# EAGLE design 261803x-HW-V1 (EAGLE 7.7.0)
Assembly variants: Thetis-I, Setebos-I, Proteus-III
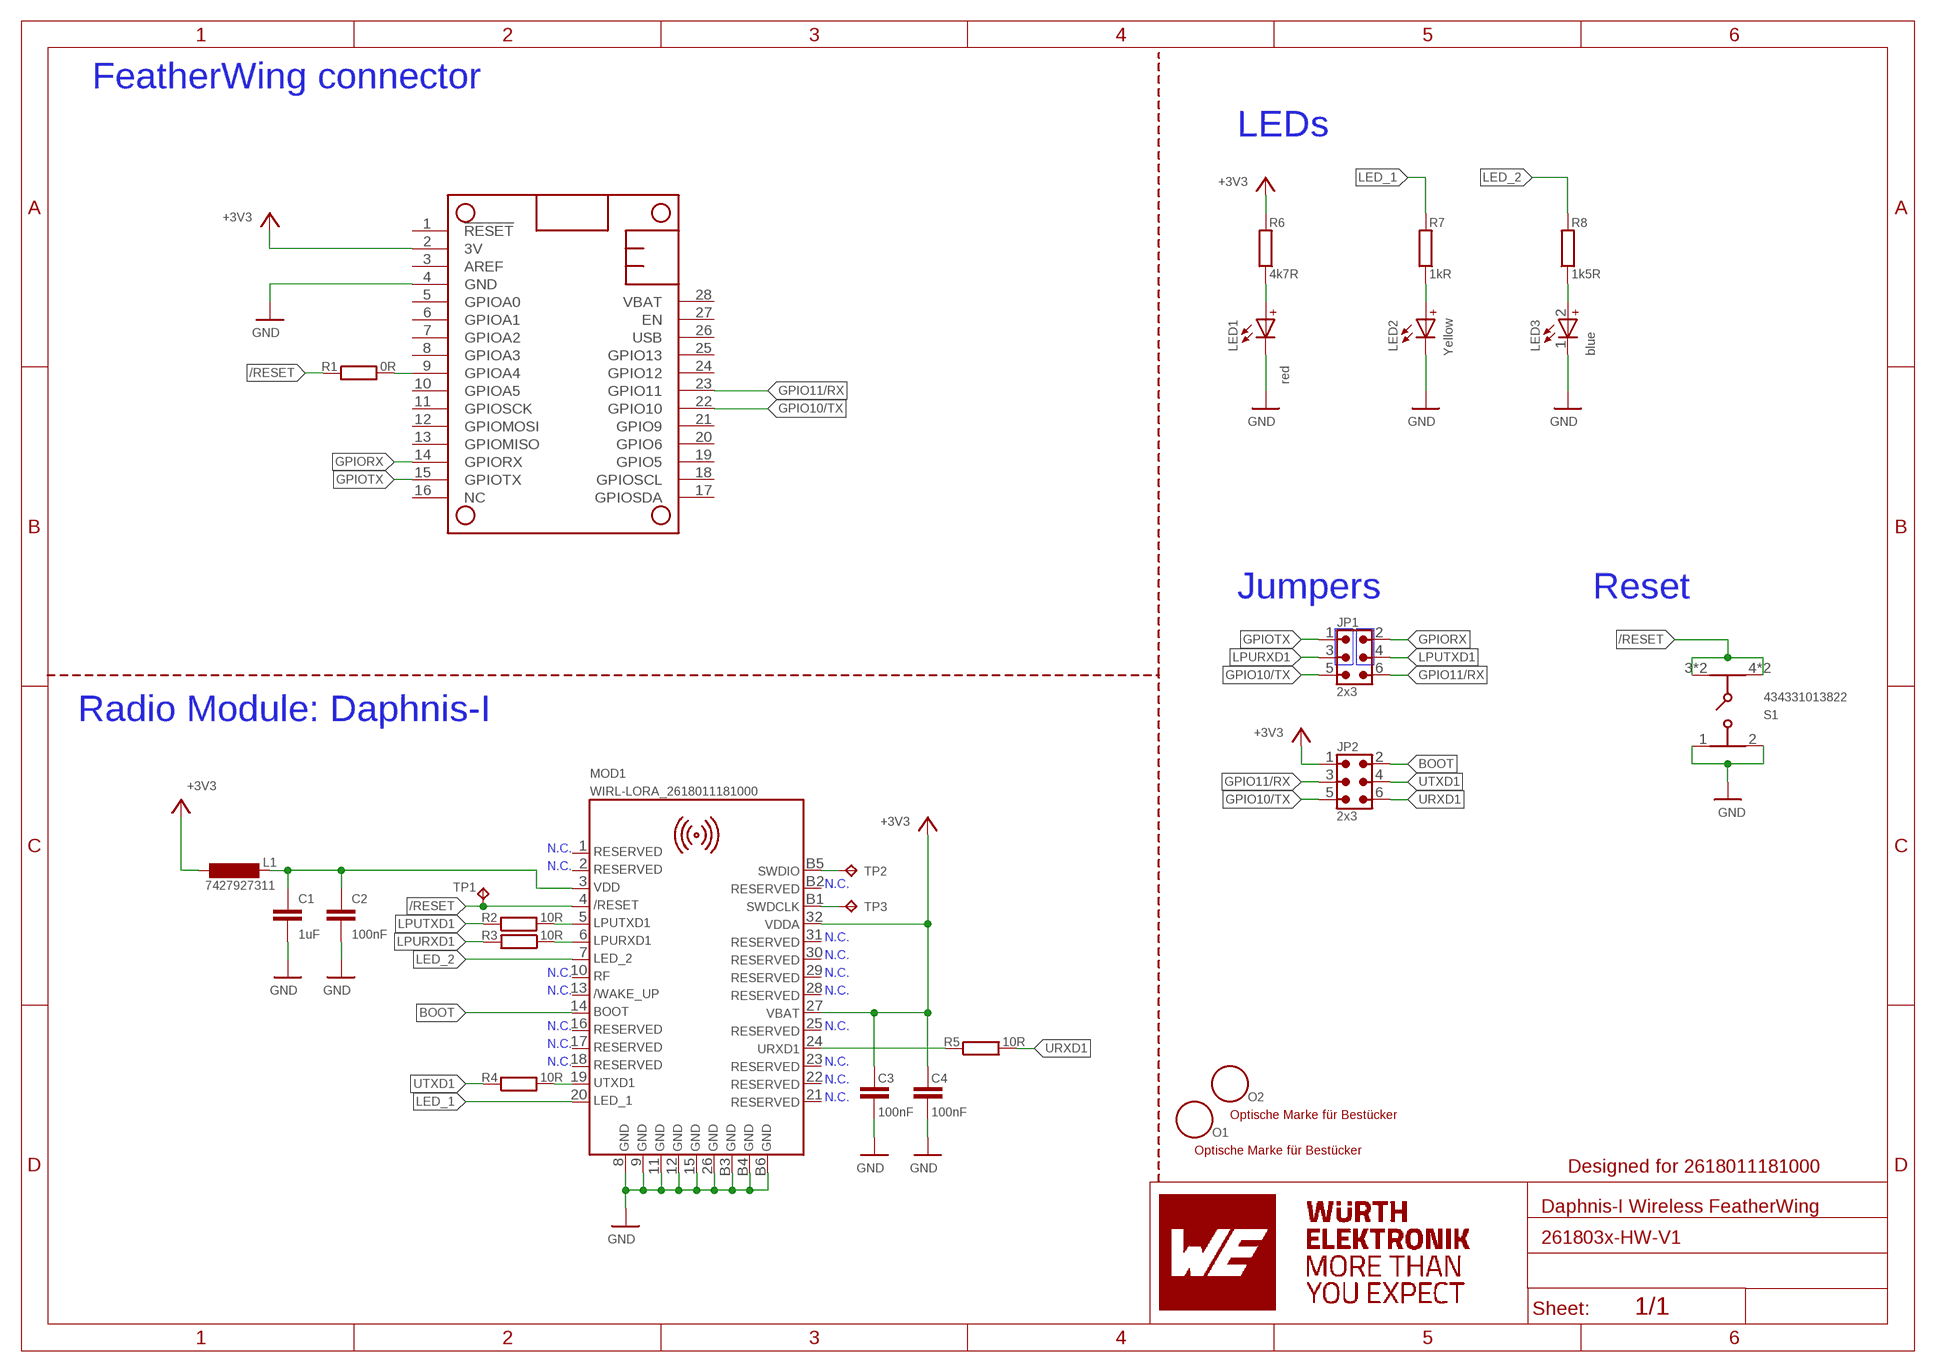
[diagram p0: schematic, sheet 1]

## Parts
C1  1uF  C1UF0402_IPC  [C0402_IPC]
C2  100nF  C100NF0402_IPC  [C0402_IPC]
C3  100nF  C100NF0402_IPC  [C0402_IPC]
C4  100nF  C100NF0402_IPC  [C0402_IPC]
JP1  2x3  6130XX21121_61300621121  [61300621121]
JP2  2x3  6130XX21121_61300621121  [61300621121]
L1  7427927311  LL0402_WE-MK  [L0402_WE-MK]
LED1  red  WL-SMSW_1204_155124VS73200  [WL-SMSW_1204_A]
LED2  Yellow  WL-SMSW_1204_155124YS73200  [WL-SMSW_1204_A]
LED3  blue  WL-SMSW_1204_155124BS73200A  [WL-SMSW_1204_A]
MOD1  WIRL-LORA_2618011181000  [WE-FP-8]
MS1  header: 1 x 12 & 1 x 16  FEATHERWING  [FEATHERWING]
O1  n.m.  OPT_MARKE  [OPTISCHE_MARKE]
O2  n.m.  OPT_MARKE  [OPTISCHE_MARKE]
R1  0R  R0R0402_IPC  [R0402_IPC]
R2  10R  R10R0402_IPC  [R0402_IPC]
R3  10R  R10R0402_IPC  [R0402_IPC]
R4  10R  R10R0402_IPC  [R0402_IPC]
R5  10R  R10R0402_IPC  [R0402_IPC]
R6  4k7R  R4K70402_IPC  [R0402_IPC]
R7  1kR  R1K0402_IPC  [R0402_IPC]
R8  1k5R  R1K5R0402_IPC  [R0402_IPC]
S1  434331013822  [434331013822]
TP1  TP15R  [TP15R]
TP2  TP15R  [TP15R]
TP3  TP15R  [TP15R]

## Nets
+3V3: C3.1 C4.1 JP2.1 L1.P$2 MOD1.27 MOD1.32 MS1.2(3V) R6.2
/RESET: MOD1.4 R1.1 S1.3 S1.4 S1.5 S1.6 TP1.P$1(TP)
BOOT: JP2.2 MOD1.14
GND: C1.2 C2.2 C3.2 C4.2 LED1.1(-) LED2.1(-) LED3.1(-) MOD1.8 MOD1.9 MOD1.11 MOD1.12 MOD1.15 MOD1.26 MOD1.B3 MOD1.B4 MOD1.B6 MS1.4(GND) S1.1 S1.2
GPIO10/TX: JP1.5 JP2.5 MS1.22(GPIO10)
GPIO11/RX: JP1.6 JP2.3 MS1.23(GPIO11)
GPIORX: JP1.2 MS1.14(GPIORX)
GPIOTX: JP1.1 MS1.15(GPIOTX)
LED_1: MOD1.20 R7.2
LED_2: MOD1.7 R8.2
LPURXD1: JP1.3 R3.2
LPUTXD1: JP1.4 R2.1
N$1: LED1.2(+) R6.1
N$2: LED2.2(+) R7.1
N$4: LED3.2(+) R8.1
N$6: C1.1 C2.1 L1.P$1 MOD1.3
N$7: MOD1.19 R4.2
N$8: MOD1.24 R5.1
N$9: MS1.9(GPIOA4) R1.2
N$10: MOD1.6 R3.1
N$11: MOD1.5 R2.2
SWDCLK: MOD1.B1 TP3.P$1(TP)
SWDIO: MOD1.B5 TP2.P$1(TP)
URXD1: JP2.6 R5.2
UTXD1: JP2.4 R4.1
Unconnected: MOD1.1 MOD1.2 MOD1.10 MOD1.13 MOD1.16 MOD1.17 MOD1.18 MOD1.21 MOD1.22 MOD1.23 MOD1.25 MOD1.28 MOD1.29 MOD1.30 MOD1.31 MOD1.B2 MS1.1(!RESET) MS1.3(AREF) MS1.5(GPIOA0) MS1.6(GPIOA1) MS1.7(GPIOA2) MS1.8(GPIOA3) MS1.10(GPIOA5) MS1.11(GPIOSCK) MS1.12(GPIOMOSI) MS1.13(GPIOMISO) MS1.16(NC) MS1.17(GPIOSDA) MS1.18(GPIOSCL) MS1.19(GPIO5) MS1.20(GPIO6) MS1.21(GPIO9) MS1.24(GPIO12) MS1.25(GPIO13) MS1.26(USB) MS1.27(EN) MS1.28(VBAT)

## Notes on the sheet
- FeatherWing connector
- LEDs
- Jumpers | Reset
- Radio Module: Daphnis-I
- N.C.
- N.C.
- N.C.
- N.C.
- N.C.
- N.C. | N.C.
- N.C. | N.C.
- N.C. | N.C.
- N.C.
- N.C. | N.C.
- N.C.
- N.C.
- Designed for 2618011181000
- Daphnis-I Wireless FeatherWing

## Library data of the parts
C1 = rcl-WE:C; HEIGHT: 0.5mm; MANUFACTURER: Würth Elektronik; NR: 885012105012; PACK: 0402; SPG: 10V; TOL: 20%
C2-C4 = rcl-WE:C; HEIGHT: 0.5mm; MANUFACTURER: Würth Elektronik; NR: 885012205037; PACK: 0402; SPG: 16V; TOL: 10%
JP1 JP2 = Eagle_WR-PHD (rev24b):6130XX21121_61300621121: WR-PHD 2.54 mm THT Dual Pin Header ARTICLE PROPERTIES: Pins:4;​ 6;​ 8;​ 10;​ 12;​ 14;​ 16;​ 18;​ 20;​ 22;​ 24;​ 26;​ 28;​ 30;​ 32;​ 34;​ 36;​ 40;​ 44;​ 64;​ 72;​ 80 KIND PROPERTIES: Pitch：2.54 mm Quality Class:3 as per CECC 75 301-802 Rows：Dual Gender：Pin Header Type：Board Stacker MATERIAL PROPERTIES: Insulator Material :PA6T Insulator Flammability Rating:UL94 V-0 Contact Material:Copper Alloy Contact Plating:Gold Contact Type:Stamped GENERAL INFORMATION Operating Temperature:-40 up to +105 °C Compliance:Lead free / RoHS ELECTRICAL PROPERTIES: Rated Current:3 A IR 1:3 A Withstanding Voltage:500 V (AC) Contact Resistance:20 mΩ RISO:1000 MΩ CERTIFICATION UL Approval:E323964 PACKAGING PROPERTIES Packaging:Bag <https://katalog.we-online.com/media/images/v2/o33215v209%20Family_WR-PHD_6130xx21121.jpg> Details see: https://katalog.we-online.com/en/em/PHD_2_54_THT_DUAL_PIN_HEADER_6130XX21121 Updated by Yingchun,Shan 2019-10-16 2019 (C) Würth Elektronik; DATASHEET-URL: https://www.we-online.com/redexpert/spec/61300621121?ae; GENDER: Pin Header; HEIGHT: 8.54mm; IR: 3A; MANUFACTURER: Würth Elektronik; MOUNT: THT; NR: 61300621121; PACK: THT; PACKAGING: Bag; PART-NUMBER: 61300621121; PINS: 6; PITCH: 2.54mm; ROWS: Dual; TYPE: Board Stacker; VALUE: 61300621121
L1 = rcl-amber:L: Spule; HEIGHT: 0.8mm; MANUFACTURER: Würth Elektronik; NR: 7427927311; PACK: 0402; TOL: 0.3nH
LED1 = 155124VS73200_Eagle_WL-SMSW_rev19a:WL-SMSW_1204: SMD Side view mono-color round Characteristics Low power consumption High reliability Low current requirement No UV/IR radiation Wide viewing angle Excelllent for edge lighting displays and backlighting indicators Ideal for miniature applications PBC high-usage Compatible with automatic placement equipment Applications Backlighting for LCD Sidelighting applications Indicator and backlighting for telecommunication Backlighting for symbol, switch and dashboard General use <http://katalog.we-online.de/media/images/v2/Family_WL-SMSW(2).jpg> Details see: http://katalog.we-online.de/en/led/WL-SMSW?m Updated: 2015-04-10 2015 (C) Wurth Elektronik; HEIGHT: 1.5mm; MANUFACTURER: Würth Elektronik; NR: 155124RS73200; PACK: 1204
LED2 = 155124VS73200_Eagle_WL-SMSW_rev19a:WL-SMSW_1204: SMD Side view mono-color round Characteristics Low power consumption High reliability Low current requirement No UV/IR radiation Wide viewing angle Excelllent for edge lighting displays and backlighting indicators Ideal for miniature applications PBC high-usage Compatible with automatic placement equipment Applications Backlighting for LCD Sidelighting applications Indicator and backlighting for telecommunication Backlighting for symbol, switch and dashboard General use <http://katalog.we-online.de/media/images/v2/Family_WL-SMSW(2).jpg> Details see: http://katalog.we-online.de/en/led/WL-SMSW?m Updated: 2015-04-10 2015 (C) Wurth Elektronik; HEIGHT: 1.5mm; MANUFACTURER: Würth Elektronik; NR: 155124YS73200; PACK: 1204
LED3 = 155124YS73200A_Eagle_WL-SMSW_rev20a:WL-SMSW_1204: WL-SMSW SMT Mono-color Side View Waterclear Characteristics High reliability Low current requirement No UV/IR radiation Wide viewing angle Excelllent for edge lighting LED displays and backlighting indicators Ideal for miniature applications Compatible with automatic placement equipment Applications Backlighting for LCD Sidelighting applications Indicator and backlighting for telecommunication Backlighting for symbols, switches and dashboards General LED lighting <https://www.we-online.com/catalog/media/o35735v209%20Family_WL-SMSW_1204_155124xx73200A.jpg> Details see: https://www.we-online.com/catalog/en/WL-SMSW/; HEIGHT: 1.5mm; MANUFACTURER: Würth Elektronik; NR: 155124BS73200A; PACK: 1204
MOD1 = WE_WIRL_Rev14.0:WIRL-LORA_2618011181000: Daphnis-I - LoRaWAN Radio Module 868 MHz WIRL-LORA Details see: https://we-online.de/katalog/en/article/2618011181000/; HEIGHT: 3.0mm; MANUFACTURER: Würth Elektronik; NR: 2618011181000; PACK: SMT
MS1 = adafruit:FEATHERWING; COMMENT: Kit containing 2 headers; MANUFACTURER: Adafruit; NR: 2830
O1 O2 = testpad:OPT_MARKE: Gemäß Vorgabe MEC
R1 = rcl-amber:R; HEIGHT: 0.35mm; MANUFACTURER: Yageo; NR: RC0402FR-070RL; PACK: 0402; TOL: 5%
R2-R5 = rcl-amber:R; HEIGHT: 0.35mm; MANUFACTURER: Yageo; NR: RC0402FR-0710RL; P: 0.063W; PACK: 0402; TOL: 1%
R6 = rcl-amber:R; HEIGHT: 0.35mm; MANUFACTURER: Yageo; NR: RC0402FR-074K7L; P: 0.063W; PACK: 0402; TOL: 1%
R7 = rcl-amber:R; HEIGHT: 0.35mm; MANUFACTURER: Yageo; NR: RC0402FR-071KL; P: 0.063W; PACK: 0402; TOL: 1%
R8 = rcl-amber:R; HEIGHT: 0.35mm; MANUFACTURER: Yageo; NR: RC0402FR-071K5L; PACK: 0402; TOL: 1%
S1 = 434331013822_Eagle_WS-TASU_rev19b:434331013822: WS-TASU Side push Tact Switch, SMD version Specification Rating : 50mA, 12VDC Contact Resistance Initial: 100mΩ max. After life test:1mΩ max. Insulation Resistance: min.100MΩ at 500VDC Dielectric Strength : 250VAC for 1 minute Stroke:0.2+0.2/-0.1mm Bounce :10ms max. Material Cover : : Stainless steel Stem :PA46 UL HB. FramePA46 UL HB, color Black >Contact : Stainless Steel with Silver Tape:Polyimide tape Terminal : Copper Alloy with Silver <http://katalog.we-online.de/media/images/v2/Family_WS-TASU_434331013822_c.jpg> Details see: http://katalog.we-online.de/en/em/TASU_3_5X2_9_SMD_SIDE_PUSH/434331013822 2015 (C) Würth Elektronik; HEIGHT: 1.35mm; MANUFACTURER: Würth Elektronik; NR: 434331013822
TP1-TP3 = testpad:TP15R

## Board
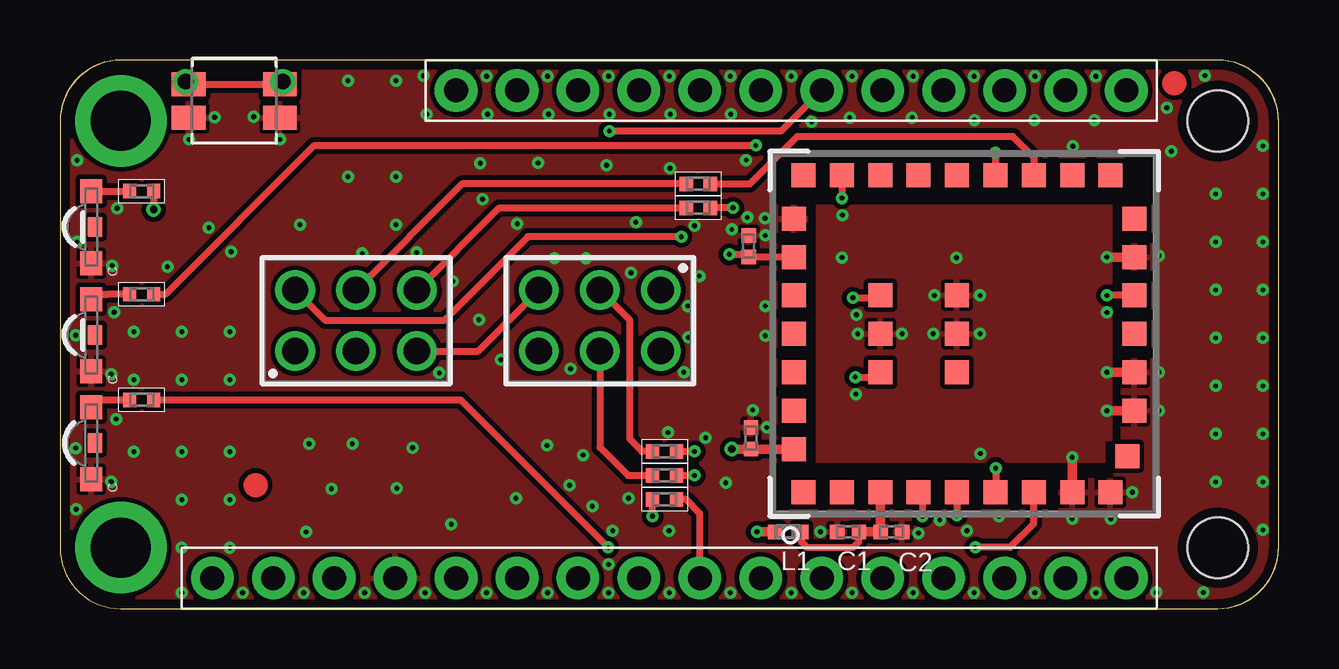
[diagram p1: board, top side]
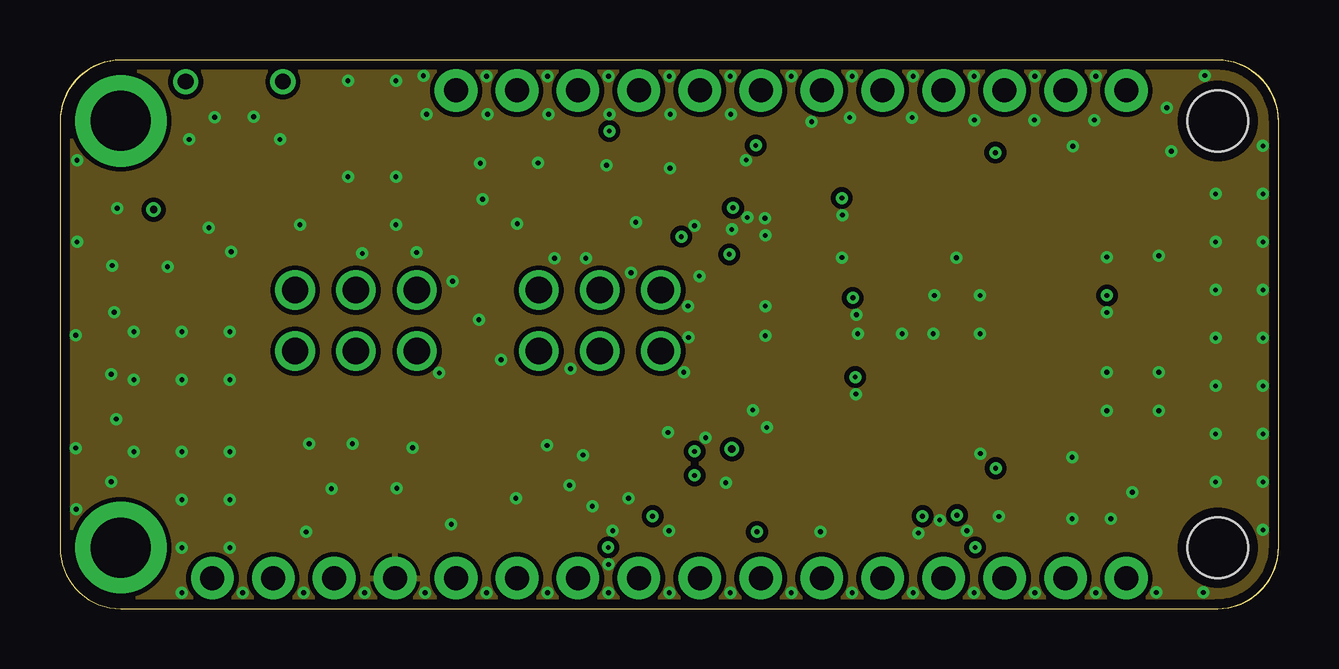
[diagram p2: board, inner layer Route2]
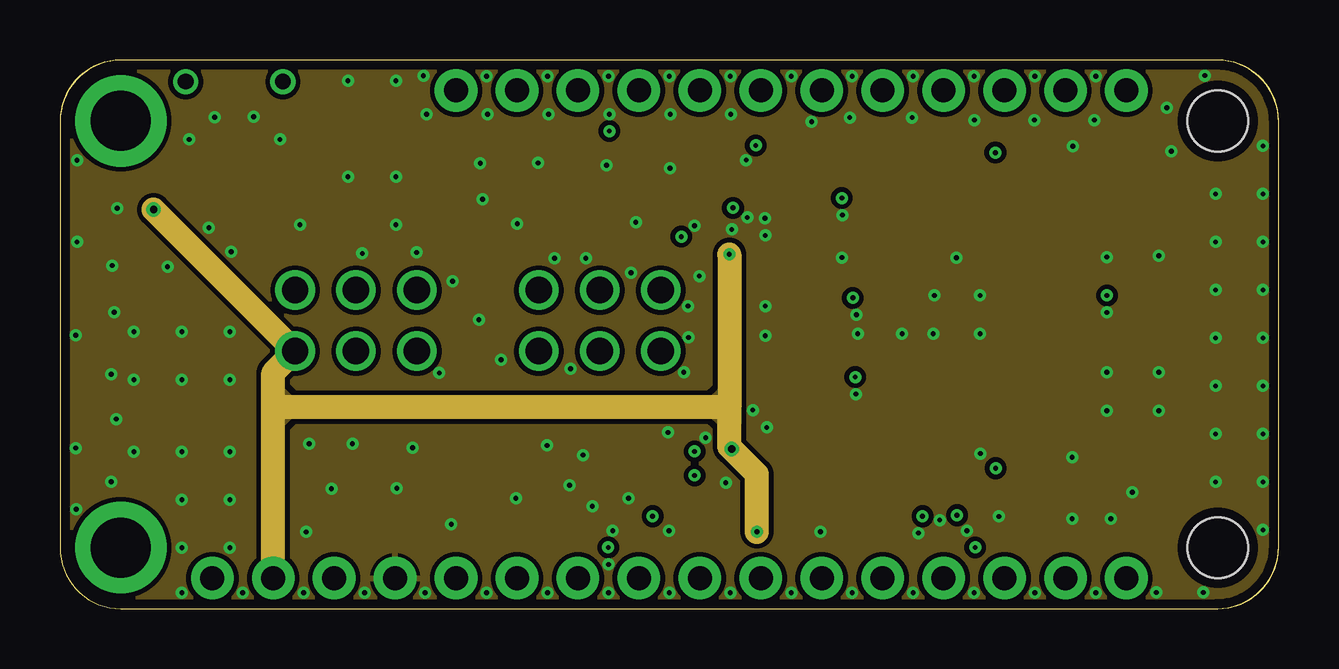
[diagram p3: board, inner layer Route15]
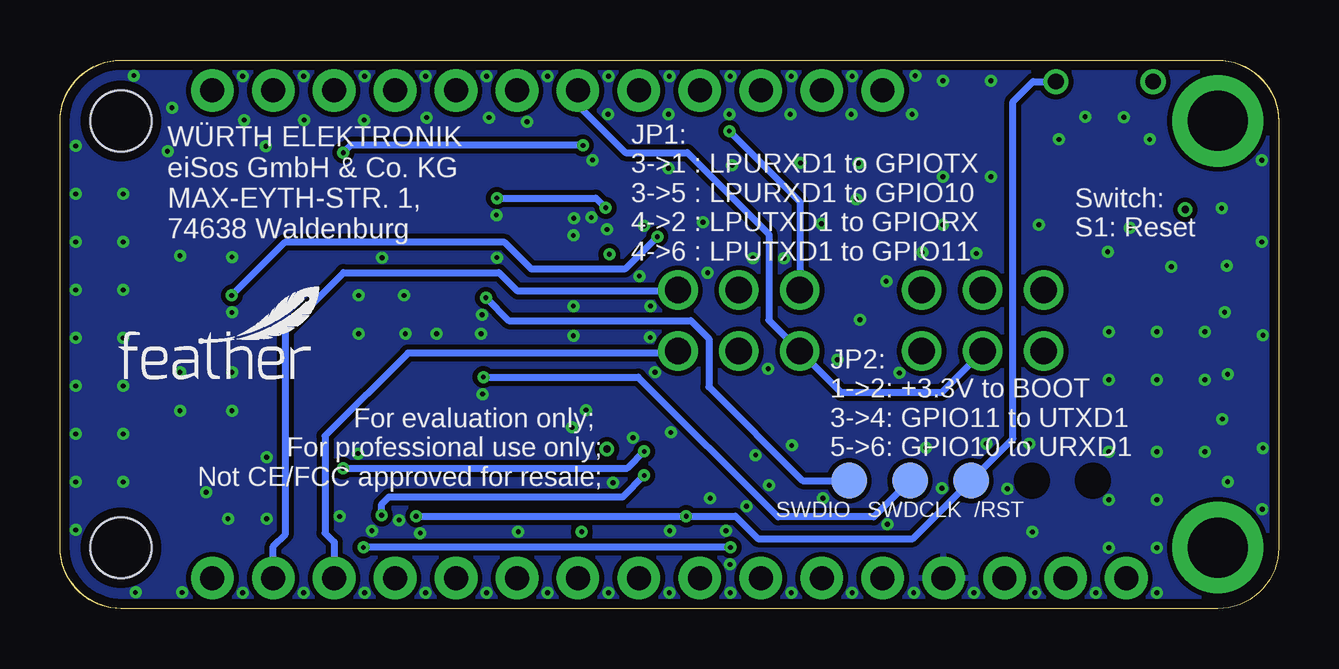
[diagram p4: board, bottom side, seen from below]

Size 50.8 x 22.86 mm. Coordinates in mm from the lower left corner, seen from the top.
Outline: 0,2.54 arc90 2.54,0 48.2,0 arc90 50.8,2.6 50.8,20.26 arc90 48.2,22.86
Outline: 2.59,22.86 arc90 0,20.27
Copper layers (1+2*15+16): Top 0.035mm / dielectric 0.412mm / Route2 0.035mm / dielectric 0.71mm / Route15 0.035mm / dielectric 0.412mm / Bottom 0.035mm
Design rules "default *": minimum track width 0.2mm, minimum drill 0.2mm, track to track 0.2mm, track to pad 0.2mm, pad to pad 0.2mm, via to via 0.2mm, smd to smd 0.2mm, copper to edge 0.4mm, drill to drill 6mil, minimum pad ring 0.2mm, minimum via ring 0.15mm, stop-mask expansion 0.05mm, vias tented up to drill 20mil, thermal gap 6mil
tRestrict: area 28.4,15.9 to 28.9,16
bRestrict: area 9.5,4.6 to 11,6.1; area 7,4.6 to 8.5,6.1

### Footprints (pad centres in the part's own frame; a part is rotated, then mirrored left to right if it is on the bottom)
C0402_IPC = smd 0.6 x 0.6: 1 -0.45,0; 2 0.45,0
61300621121 = drill 1.1: 1 -2.54,-1.27; 2 -2.54,1.27; 3 0,-1.27; 4 0,1.27; 5 2.54,-1.27; 6 2.54,1.27
L0402_WE-MK = smd 0.6 x 0.6: P$1 -0.55,0; P$2 0.55,0
WL-SMSW_1204_A = smd 1 x 0.9: 1 -1.5,0; 2 1.5,0 | smd 0.8 x 0.6: 3 0,-0.15
WE-FP-8 = smd 1 x 1: 1 -6.6,6.7; 2 -6.6,5.1; 3 -6.6,3.5; 4 -6.6,1.9; 5 -6.6,0.3; 6 -6.6,-1.3; 7 -6.6,-2.9; 8 -6.6,-4.5; 9 -6.6,-6.1; 10 -5.1,-6.8; 11 -3.2,-7.1; 12 -1.6,-7.1; 13 0,-7.1; 14 1.6,-7.1; 15 3.2,-7.1; 16 4.8,-7.1; 17 6.6,-6.1; 18 6.6,-4.5; 19 6.6,-2.9; 20 6.6,-1.3; 21 6.6,0.3; 22 6.6,1.9; 23 6.6,3.5; 24 6.6,5.1; 25 6.6,6.7; 26 4.8,7.1; 27 3.2,7.1; 28 1.6,7.1; 29 0,7.1; 30 -1.6,7.1; 31 -3.2,7.1; 32 -4.8,7.1; B1 -1.6,3.5; B2 -1.6,0.3; B3 0,0.3; B4 1.6,0.3; B5 1.6,3.5; B6 0,3.5
FEATHERWING = drill 1 pad 1.778: 1 6.35,1.27; 2 8.89,1.27; 3 11.43,1.27; 4 13.97,1.27; 5 16.51,1.27; 6 19.05,1.27; 7 21.59,1.27; 8 24.13,1.27; 9 26.67,1.27; 10 29.21,1.27; 11 31.75,1.27; 12 34.29,1.27; 13 36.83,1.27; 14 39.37,1.27; 15 41.91,1.27; 16 44.45,1.27; 17 44.45,21.59; 18 41.91,21.59; 19 39.37,21.59; 20 36.83,21.59; 21 34.29,21.59; 22 31.75,21.59; 23 29.21,21.59; 24 26.67,21.59; 25 24.13,21.59; 26 21.59,21.59; 27 19.05,21.59; 28 16.51,21.59 | drill 2.5 pad 3.81: P$1 2.54,20.32; P$2 2.54,2.54 | hole 2.54: 48.26,20.32; 48.26,2.54
R0402_IPC = smd 0.55 x 0.6: 1 -0.5,0; 2 0.5,0
434331013822 = smd 1.4 x 1: 1 -1.9,0.7; 2 1.9,0.7; 3 1.9,-0.7; 4 -1.9,-0.7 | drill 0.65 pad 0.78: 5 -2.025,-0.8; 6 2.025,-0.8
TP15R = smd 1.5 x 1.5: P$1 0,0

### Placement (x,y rotation side)
C1  32.85,3.2 180 top
C2  34.65,3.2 0 top
C3  28.8,7.1 90 top
C4  28.7,15.1 90 top
JP1  22.5,12 180 top
JP2  12.34,12 0 top
L1  30.35,3.2 180 top
LED1  1.3,15.9 90 top
LED2  1.3,11.4 90 top
LED3  1.3,6.9 90 top
MOD1  37.69,11.45 90 top
MS1  0,0 0 top
O1  8.15,5.15 0 top
O2  46.45,21.9 0 top
R1  25.2,4.55 0 top
R2  25.2,5.55 0 top
R3  25.2,6.55 180 top
R4  26.6,17.7 0 top
R5  26.6,16.7 180 top
R6  3.4,17.4 0 top
R7  3.4,13.1 0 top
R8  3.4,8.7 0 top
S1  7.26,21.16 180 top
TP1  12.83,5.33 0 bottom
TP2  17.91,5.33 0 bottom
TP3  15.37,5.33 0 bottom
U$3  [FEATHER_8MM]  48.35,9.55 0 bottom

### Tracks (layer width: path | path; a pad name or v marks a point on that pad's centre or on a via)
+3V3  (via drill 0.2, 0.3)
  Top 0.3: MOD1.27 C4.1 | 28.6,14.75 C4.1 | v27.9,14.76 28.59,14.76 C4.1 | R6.2 v3.9,16.63
  Top 0.4: MOD1.32 C3.1 v28,6.65 | L1.P$2 v29.05,3.2
  Route15 1: MS1.2 8.89,8.5 | 8.89,8.5 8.89,9.82 JP2.1 v3.9,16.63 | v29.05,3.2 29.05,5.6 v28,6.65 27.9,6.75 27.9,8.4 | v27.9,14.76 27.9,8.4 | 27.9,8.4 8.99,8.4 8.89,8.5
  pour Route15: 8.5,9.1 9.3,9.1 9.7,8.7 9.7,8.1 9.3,7.7 8.5,7.7
  pour Route15: 28.3,7.7 27.5,7.7 27.1,8.1 27.1,8.7 27.5,9.1 28.3,9.1
/RESET  (via drill 0.2)
  Top 0.3: MOD1.4 35.95,4.69 v35.95,3.85 | v24.7,3.85 R1.1 | S1.5 9.19,21.86 S1.4 S1.3 5.34,21.86 S1.6
  Bottom 0.3: v35.95,3.85 v24.7,3.85 22.65,3.85 21.71,2.91 15.25,2.91 TP1.P$1 11.07,7.09 11.07,21.12 10.24,21.96 S1.5
BOOT  (via drill 0.2)
  Top 0.3: MOD1.14 v43.64,13.05 | v25.9,15.5 19.5,15.5 16,12 11.07,12 JP2.2
  Bottom 0.3: v25.9,15.5 27.25,14.15 31.15,14.15 32.26,15.26 41.43,15.26 v43.64,13.05
GND  (via drill 0.2)
  Top 0.4: MOD1.15 v43.63,14.65 | MOD1.12 v43.63,9.85 | MOD1.11 v43.63,8.25 | MOD1.8 v42.19,6.31
  other vias: 28.65,16.3 2.17,14.3 29.38,16.27 28.88,8.28 31.7,3.2 35.78,3.15 33.25,11.45 35.1,11.45 36.4,11.45 38.35,11.45 38.35,13.05 36.45,13.05 42.19,3.75 43.8,3.75 44.7,4.85 45.8,8.25 45.8,9.85 45.8,14.7 43.63,12.34 38.37,6.46 33.18,8.94 33.2,12.24 37.37,14.62 32.59,14.63 45.7,0.68 47.65,0.68 50.15,3.28 50.15,5.28 50.15,7.28 50.15,9.28 50.15,11.28 50.15,13.28 50.15,15.28 50.15,17.28 50.15,19.28 47.72,22.21 48.17,17.28 48.17,15.28 48.17,13.28 48.17,11.28 48.17,9.28 48.17,7.28 48.17,5.28 32.61,16.4 28.6,18.69 22.9,20.6 22.87,1.84 25.38,3.24 26.91,7.12 10,16 14,16 14,18 12,18 6.45,20.48 8.07,20.49 5.38,19.55 9.17,19.55 15.15,22.2 17.78,22.18 20.32,22.18 25.4,22.18 33.02,22.18 35.56,22.18 38.1,22.18 40.64,22.18 43.18,22.18 43.18,0.67 40.64,0.67 38.1,0.67 35.56,0.67 33.02,0.67 30.48,0.67 27.94,0.67 25.4,0.67 22.86,0.67 20.32,0.67 17.78,0.67 12.7,0.67 15.21,0.67 10.16,0.67 7.62,0.67 5.08,0.67 5.08,2.54 10.27,3.19 10.39,6.87 14.04,5.02 19,4.6 14.7,6.7 20.3,6.8 21.8,6.4 23.7,4.6 26.2,11.3 23.8,14 26.45,15.95 24,16.1 21.28,10 14.86,14.84 17.61,17.06 17.52,18.56 19.93,18.57 22.78,18.47 25.43,18.35 15.81,9.82 29.46,7.55 27.75,5.25 28,15.8 29.4,15.55 36.67,3.69 23.04,3.25 16.31,3.52 22.19,4.27 37.8,3.24 39.14,3.84 29.4,11.37 29.4,12.61 26.18,12.61 0.68,4.14 0.66,6.69 0.66,11.39 0.71,15.28 0.71,18.68 25.34,7.34 21.24,5.14 32.92,20.46 31.33,20.29 35.52,20.46 38.12,20.36 40.62,20.36 43.12,20.36 42.22,19.26 46.32,19.06 16.36,13.64 19.06,16.04 17.46,12.04 20.62,14.6 21.92,14.6 26.65,13.86 12.6,14.8 2.38,16.68 2.25,12.36 2.35,7.9 26,9.85 20.36,20.6 17.82,20.6 15.28,20.6 25.44,20.6 27.96,20.6 22.86,22.18 27.94,22.18 30.48,22.18 46.13,20.87 12.19,6.87 18.39,10.37 2.13,9.77 2.13,5.29 5.08,4.54 5.08,6.54 5.08,9.54 7.08,9.54 5.08,11.54 7.08,11.54 3.08,11.54 3.08,9.54 3.08,6.54 7.08,6.54 7.08,4.54 7.08,2.54 4.48,14.24 6.21,15.87 7.13,14.87 11.31,5 12,22 14,22
  pour Bottom: 0,12.06 0,20.32 arc-90 2.54,22.86 48.26,22.86 arc-90 50.8,20.32 50.8,2.67 arc-90 48.13,0 2.41,0 arc-90 0,2.41
  pour Route2: 0,0 0,22.86 50.8,22.86 50.8,0
  pour Top: 0,12.06 0,20.32 arc-90 2.54,22.86 48.26,22.86 arc-90 50.8,20.32 50.8,2.67 arc-90 48.13,0 2.41,0 arc-90 0,2.41
  pour Route15 (rank 2): 0,0 0,22.86 50.8,22.86 50.8,0
GPIO10/TX  (via drill 0.2)
  Top 0.3: MS1.22 30.06,19.9 v22.9,19.9 | JP2.5 17.42,10.73 JP1.5
  Bottom 0.3: v22.9,19.9 19.96,16.96 JP1.5
GPIO11/RX
  Bottom 0.3: MS1.23 29.21,20.98 27.23,19 24.65,19 21.25,15.6 21.25,12.02 JP1.6 18.23,9 14.07,9 JP2.3
GPIORX
  Bottom 0.3: JP1.2 25.12,10.65 36.3,10.65 39.75,7.2 39.75,3.15 39.37,2.77 MS1.14
GPIOTX
  Bottom 0.3: MS1.15 41.91,2.59 41.4,3.1 41.4,11.58 38.98,14 32.5,14 31.73,13.22 25.09,13.22 JP1.1
LED_1  (via drill 0.2)
  Top 0.3: v29,19.3 10.6,19.3 4.4,13.1 R7.2 | v38.99,19 MOD1.20
  Bottom 0.3: v29,19.3 38.69,19.3 v38.99,19
LED_2  (via drill 0.2)
  Top 0.3: v22.85,2.55 16.7,8.7 R8.2 | MOD1.7 40.59,3.54 39.6,2.55 v38.15,2.55
  Bottom 0.3: v22.85,2.55 v38.15,2.55
LPURXD1
  Top 0.3: JP1.3 23.75,12.02 23.75,7.06 24.26,6.55 R3.2
LPUTXD1
  Top 0.3: JP1.4 22.5,6.72 23.67,5.55 R2.1
N$1
  Top 0.3: LED1.2 R6.1
N$2
  Top 0.3: R7.1 2,13.1 1.5,13.1 LED2.2
N$4
  Top 0.3: R8.1 1.6,8.7 LED3.2
N$6
  Top 0.3: L1.P$1 30.9,2.78 31.13,2.55 33.07,2.55 33.3,2.78 C1.1
  Top 0.4: C1.1 C2.1 MOD1.3
N$7
  Top 0.3: MOD1.19 40.59,18.8 39.72,19.67 30.72,19.67 28.75,17.7 R4.2
N$8  (via drill 0.2)
  Top 0.3: MOD1.24 v32.59,17.11 | v28.05,16.7 R5.1
  Bottom 0.3: v32.59,17.11 28.46,17.11 v28.05,16.7
N$9
  Top 0.3: MS1.9 26.67,3.96 26.08,4.55 R1.2
N$10  (via drill 0.2)
  Top 0.3: v39,5.85 MOD1.6 | R3.1 v26.45,6.55
  Bottom 0.3: v26.45,6.55 27.15,5.85 v39,5.85
N$11  (via drill 0.2)
  Top 0.3: MOD1.5 v37.39,3.89 | R2.2 v26.45,5.55
  Bottom 0.3: v26.45,5.55 27.35,4.65 37.1,4.65 37.39,4.36 v37.39,3.89
SWDCLK  (via drill 0.2)
  Top 0.3: v33.15,9.65 33.99,9.65 MOD1.B1
  Bottom 0.3: v33.15,9.65 26.7,9.65 20.87,3.82 16.88,3.82 TP3.P$1
SWDIO  (via drill 0.2)
  Top 0.3: v33.05,12.95 34.09,12.95 MOD1.B5
  Bottom 0.3: v33.05,12.95 32.1,12 24.5,12 23.75,11.25 23.75,9.24 19.84,5.33 TP2.P$1
URXD1
  Top 0.3: JP2.6 18.31,16.7 R5.2
UTXD1
  Top 0.3: R4.1 16.77,17.7 JP2.4

### Text on the board
bNames: Switch: / S1: Reset | WÜRTH ELEKTRONIK / eiSos GmbH & Co. KG / MAX-EYTH-STR. 1, / 74638 Waldenburg | JP1: / 3->1 : LPURXD1 to GPIOTX / 3->5 : LPURXD1 to GPIO10 / 4->2 : LPUTXD1 to GPIORX / 4->6 : LPUTXD1 to GPIO11 | For evaluation only; / For professional use only; / Not CE/FCC approved for resale; | JP2: / 1->2: +3.3V to BOOT / 3->4: GPIO11 to UTXD1 / 5->6: GPIO10 to URXD1 | /RST | SWDCLK | SWDIO
tPrint: VBAT | EN | 5V | 13 | 12 | 11 | 9 | 6 | 5 | SCL | SDA | 10 | HW-V1 | 1 | 1 | !RST | 3V3 | AREF | GND | A0 | A1 | A2 | A3 | A4 | A5 | MI | RX | TX | NC